# Altium project Main-PCB-v1.0.PrjPcb (part 1 of 3)
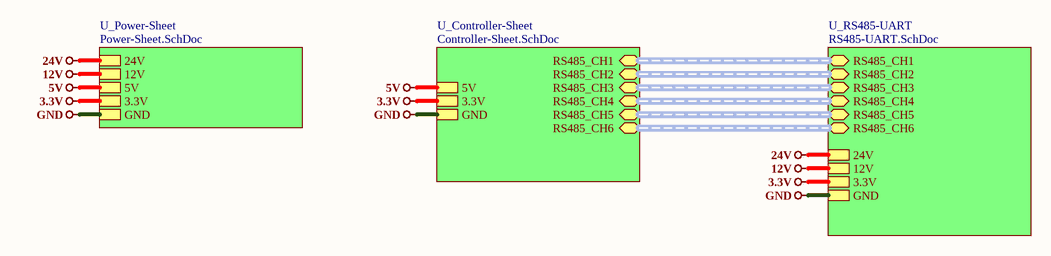
[diagram p0: Top_Sheet.SchDoc]
4 sheets, 252 parts. Net scope: hierarchical (ports join the sheet entries above them; power ports are global).
Board file: Main-PCB-v1.0.PcbDoc
Sheets:
  Top_Sheet.SchDoc
    U_Controller-Sheet = Controller-Sheet.SchDoc
    U_Power-Sheet = Power-Sheet.SchDoc
    U_RS485-UART = RS485-UART.SchDoc

## Sheet Top_Sheet.SchDoc
size A4; SheetNumber: 1; SheetTotal: 4

### Sub-sheets
U_Controller-Sheet = Controller-Sheet.SchDoc: RS485_CH1 (bidir, harness RS485_CH1), RS485_CH2 (bidir, harness RS485_CH2), RS485_CH3 (bidir, harness RS485_CH3), RS485_CH4 (bidir, harness RS485_CH4), RS485_CH5 (bidir, harness RS485_CH5), RS485_CH6 (bidir, harness RS485_CH6), GND, 3.3V, 5V
U_Power-Sheet = Power-Sheet.SchDoc: GND, 3.3V, 12V, 24V, 5V
U_RS485-UART = RS485-UART.SchDoc: RS485_CH1 (bidir, harness RS485_CH1), RS485_CH2 (bidir, harness RS485_CH2), RS485_CH3 (bidir, harness RS485_CH3), RS485_CH4 (bidir, harness RS485_CH4), RS485_CH5 (bidir, harness RS485_CH5), RS485_CH6 (bidir, harness RS485_CH6), GND, 3.3V, 12V, 24V

### Nets
3.3V: sheet U_Controller-Sheet/3.3V, sheet U_Power-Sheet/3.3V, sheet U_RS485-UART/3.3V
5V: sheet U_Controller-Sheet/5V, sheet U_Power-Sheet/5V
12V: sheet U_Power-Sheet/12V, sheet U_RS485-UART/12V
24V: sheet U_Power-Sheet/24V, sheet U_RS485-UART/24V
GND: sheet U_Controller-Sheet/GND, sheet U_Power-Sheet/GND, sheet U_RS485-UART/GND

### Buses and harness runs
harness sheet U_Controller-Sheet/RS485_CH1 = sheet U_RS485-UART/RS485_CH1
harness sheet U_Controller-Sheet/RS485_CH2 = sheet U_RS485-UART/RS485_CH2
harness sheet U_Controller-Sheet/RS485_CH3 = sheet U_RS485-UART/RS485_CH3
harness sheet U_Controller-Sheet/RS485_CH4 = sheet U_RS485-UART/RS485_CH4
harness sheet U_Controller-Sheet/RS485_CH5 = sheet U_RS485-UART/RS485_CH5
harness sheet U_Controller-Sheet/RS485_CH6 = sheet U_RS485-UART/RS485_CH6

## Sheet Controller-Sheet.SchDoc
size 420 x 297 mm; SheetNumber: 3; SheetTotal: 4
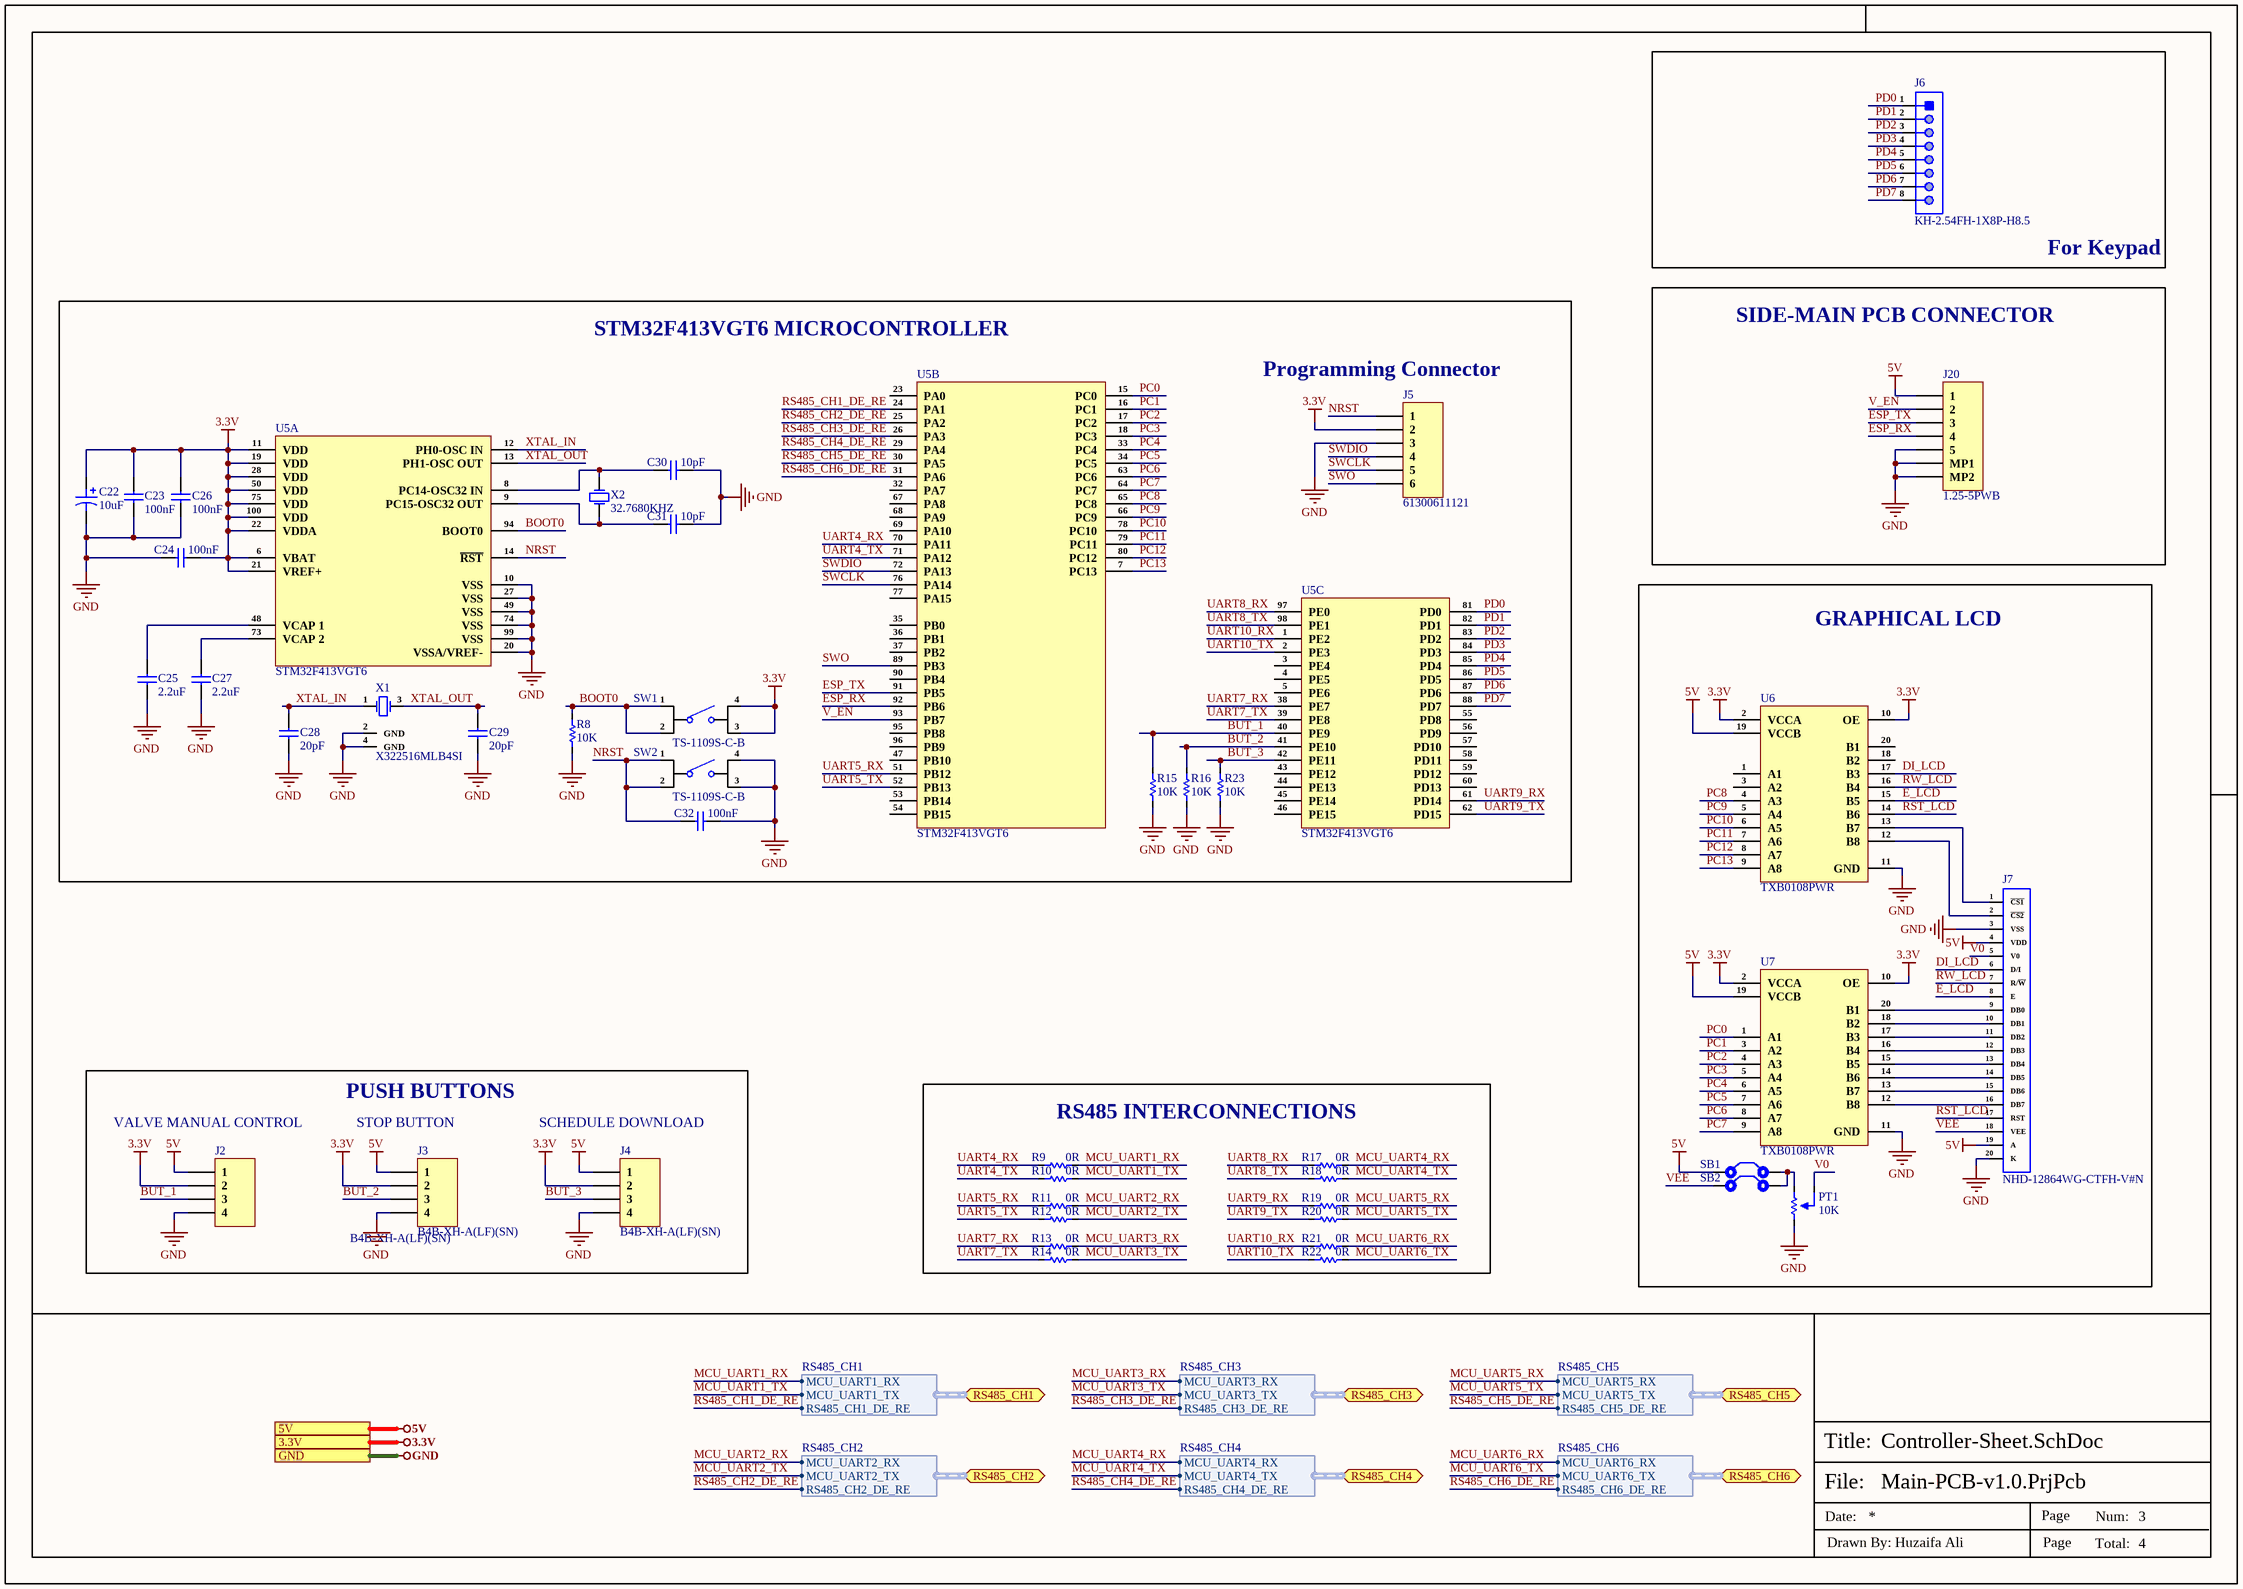
[diagram p1: Controller-Sheet.SchDoc]

### Parts
C22  10uF  [Case-A]
C23  100nF  [Cap-0603]
C24  100nF  [Cap-0603]
C25  2.2uF  [Cap-0805]
C26  100nF  [Cap-0603]
C27  2.2uF  [Cap-0805]
C28  20pF  [Cap-0603]
C29  20pF  [Cap-0603]
C30  10pF  [Cap-0603]
C31  10pF  [Cap-0603]
C32  100nF  [Cap-0603]
J2  B4B-XH-A(LF)(SN)  [B4B-XH-A(LF)(SN).]
J3  B4B-XH-A(LF)(SN)  [B4B-XH-A(LF)(SN).]
J4  B4B-XH-A(LF)(SN)  [B4B-XH-A(LF)(SN).]
J5  61300611121  [HDR1X6_]
J6  KH-2.54FH-1X8P-H8.5  [HDR1X8 Female]
J7  NHD-12864WG-CTFH-V#N  [NHD-12864WG-CTFH-V#N]
J20  1.25-5PWB  [1.25-5PWB]
PT1  10K  [3313J-1-103E]
R8  10K  [Res-0402]
R9  0R  [Res-0402]
R10  0R  [Res-0402]
R11  0R  [Res-0402]
R12  0R  [Res-0402]
R13  0R  [Res-0402]
R14  0R  [Res-0402]
R15  10K  [Res-0402]
R16  10K  [Res-0402]
R17  0R  [Res-0402]
R18  0R  [Res-0402]
R19  0R  [Res-0402]
R20  0R  [Res-0402]
R21  0R  [Res-0402]
R22  0R  [Res-0402]
R23  10K  [Res-0402]
SB1  Solder Bridge 0402  [Solder Bridge 0402]  (value not drawn)
SB2  Solder Bridge 0402  [Solder Bridge 0402]  (value not drawn)
SW1  TS-1109S-C-B  [TS-1109S-C-B]
SW2  TS-1109S-C-B  [TS-1109S-C-B]
U5  STM32F413VGT6  [LQFP-100]  (parts A,B,C of 3)
U6  TXB0108PWR  [TSSOP-20]
U7  TXB0108PWR  [TSSOP-20]
X1  X322516MLB4SI  [SMD3225-4P]
X2  32.7680KHZ  [NX3215SA-32.768K-STD-MUA-8_]

### Blocks framed on the sheet
For Keypad: J6
SIDE-MAIN PCB CONNECTOR: J20
GRAPHICAL LCD: J7 PT1 SB1 SB2 U6 U7
PUSH BUTTONS: J2-J4
RS485 INTERCONNECTIONS: R9-R14 R17-R22

### Ports
3.3V, 5V, GND, RS485_CH1 (bidir, harness RS485_CH1), RS485_CH2 (bidir, harness RS485_CH2), RS485_CH3 (bidir, harness RS485_CH3), RS485_CH4 (bidir, harness RS485_CH4), RS485_CH5 (bidir, harness RS485_CH5), RS485_CH6 (bidir, harness RS485_CH6)

### Harnesses
RS485_CH1: MCU_UART1_RX, MCU_UART1_TX, RS485_CH1_DE_RE
RS485_CH2: MCU_UART2_RX, MCU_UART2_TX, RS485_CH2_DE_RE
RS485_CH3: MCU_UART3_RX, MCU_UART3_TX, RS485_CH3_DE_RE
RS485_CH4: MCU_UART4_RX, MCU_UART4_TX, RS485_CH4_DE_RE
RS485_CH5: MCU_UART5_RX, MCU_UART5_TX, RS485_CH5_DE_RE
RS485_CH6: MCU_UART6_RX, MCU_UART6_TX, RS485_CH6_DE_RE

### Nets
3.3V: C22.1 C23.2 C24.2 C26.2 J2.2 J3.2 J4.2 J5.2 SW1.3 SW1.4 U5.6(VBAT) U5.11(VDD) U5.19(VDD) U5.21(VREF+) U5.22(VDDA) U5.28(VDD) U5.50(VDD) U5.75(VDD) U5.100(VDD) U6.2(VCCA) U6.10(OE) U7.2(VCCA) U7.10(OE) ; port 3.3V
5V: J2.1 J3.1 J4.1 J7.4(VDD) J7.19(A) J20.1 SB1.1 U6.19(VCCB) U7.19(VCCB) ; port 5V
GND: C22.2 C23.1 C24.1 C25.1 C26.1 C27.1 C28.1 C29.1 C30.2 C31.2 C32.1 J2.4 J3.4 J4.4 J5.3 J7.3(VSS) J7.20(K) J20.5 J20.MP1 J20.MP2 PT1.3(CW) R8.1 R15.1 R16.1 R23.1 SW2.3 SW2.4 U5.10(VSS) U5.20(VSSA/VREF-) U5.27(VSS) U5.49(VSS) U5.74(VSS) U5.99(VSS) U6.11(GND) U7.11(GND) X1.2(GND) X1.4(GND) ; port GND
BOOT0: R8.2 SW1.1 SW1.2 U5.94(BOOT0)
BUT_1: J2.3 R15.2 U5.40(PE9)
BUT_2: J3.3 R16.2 U5.41(PE10)
BUT_3: J4.3 R23.2 U5.42(PE11)
DI_LCD: J7.6(D/I) U6.17(B3)
E_LCD: J7.8(E) U6.15(B5)
ESP_RX: J20.4 U5.92(PB6)
ESP_TX: J20.3 U5.91(PB5)
MCU_UART1_RX: R9.2 ; port RS485_CH1.MCU_UART1_RX
MCU_UART1_TX: R10.2 ; port RS485_CH1.MCU_UART1_TX
MCU_UART2_RX: R11.2 ; port RS485_CH2.MCU_UART2_RX
MCU_UART2_TX: R12.2 ; port RS485_CH2.MCU_UART2_TX
MCU_UART3_RX: R13.2 ; port RS485_CH3.MCU_UART3_RX
MCU_UART3_TX: R14.2 ; port RS485_CH3.MCU_UART3_TX
MCU_UART4_RX: R17.2 ; port RS485_CH4.MCU_UART4_RX
MCU_UART4_TX: R18.2 ; port RS485_CH4.MCU_UART4_TX
MCU_UART5_RX: R19.2 ; port RS485_CH5.MCU_UART5_RX
MCU_UART5_TX: R20.2 ; port RS485_CH5.MCU_UART5_TX
MCU_UART6_RX: R21.2 ; port RS485_CH6.MCU_UART6_RX
MCU_UART6_TX: R22.2 ; port RS485_CH6.MCU_UART6_TX
NRST: C32.2 J5.1 SW2.1 SW2.2 U5.14(~{RST})
PC0: U5.15(PC0) U7.1(A1)
PC1: U5.16(PC1) U7.3(A2)
PC2: U5.17(PC2) U7.4(A3)
PC3: U5.18(PC3) U7.5(A4)
PC4: U5.33(PC4) U7.6(A5)
PC5: U5.34(PC5) U7.7(A6)
PC6: U5.63(PC6) U7.8(A7)
PC7: U5.64(PC7) U7.9(A8)
PC8: U5.65(PC8) U6.4(A3)
PC9: U5.66(PC9) U6.5(A4)
PC10: U5.78(PC10) U6.6(A5)
PC11: U5.79(PC11) U6.7(A6)
PC12: U5.80(PC12) U6.8(A7)
PC13: U5.7(PC13) U6.9(A8)
PD0: J6.1 U5.81(PD0)
PD1: J6.2 U5.82(PD1)
PD2: J6.3 U5.83(PD2)
PD3: J6.4 U5.84(PD3)
PD4: J6.5 U5.85(PD4)
PD5: J6.6 U5.86(PD5)
PD6: J6.7 U5.87(PD6)
PD7: J6.8 U5.88(PD7)
RS485_CH1_DE_RE: U5.24(PA1) ; port RS485_CH1.RS485_CH1_DE_RE
RS485_CH2_DE_RE: U5.25(PA2) ; port RS485_CH2.RS485_CH2_DE_RE
RS485_CH3_DE_RE: U5.26(PA3) ; port RS485_CH3.RS485_CH3_DE_RE
RS485_CH4_DE_RE: U5.29(PA4) ; port RS485_CH4.RS485_CH4_DE_RE
RS485_CH5_DE_RE: U5.30(PA5) ; port RS485_CH5.RS485_CH5_DE_RE
RS485_CH6_DE_RE: U5.31(PA6) ; port RS485_CH6.RS485_CH6_DE_RE
RST_LCD: J7.17(RST) U6.14(B6)
RW_LCD: J7.7(R/~{W}) U6.16(B4)
SWCLK: J5.5 U5.76(PA14)
SWDIO: J5.4 U5.72(PA13)
SWO: J5.6 U5.89(PB3)
UART4_RX: R9.1 U5.70(PA11)
UART4_TX: R10.1 U5.71(PA12)
UART5_RX: R11.1 U5.51(PB12)
UART5_TX: R12.1 U5.52(PB13)
UART7_RX: R13.1 U5.38(PE7)
UART7_TX: R14.1 U5.39(PE8)
UART8_RX: R17.1 U5.97(PE0)
UART8_TX: R18.1 U5.98(PE1)
UART9_RX: R19.1 U5.61(PD14)
UART9_TX: R20.1 U5.62(PD15)
UART10_RX: R21.1 U5.1(PE2)
UART10_TX: R22.1 U5.2(PE3)
V0: J7.5(V0) PT1.2(Wiper)
V_EN: J20.2 U5.93(PB7)
VEE: J7.18(VEE) SB2.1
XTAL_IN: C28.2 U5.12(PH0-OSC_IN) X1.1(CRYSTAL)
XTAL_OUT: C29.2 U5.13(PH1-OSC_OUT) X1.3(CRYSTAL)
NetC25_2: C25.2 U5.48(VCAP_1)
NetC27_2: C27.2 U5.73(VCAP_2)
NetC30_1: C30.1 U5.8(PC14-OSC32_IN) X2.1(OSC1)
NetC31_1: C31.1 U5.9(PC15-OSC32_OUT) X2.2(OSC2)
NetJ7_1: J7.1(~{CS1}) U6.13(B7)
NetJ7_2: J7.2(~{CS2}) U6.12(B8)
NetJ7_9: J7.9(DB0) U7.20(B1)
NetJ7_10: J7.10(DB1) U7.18(B2)
NetJ7_11: J7.11(DB2) U7.17(B3)
NetJ7_12: J7.12(DB3) U7.16(B4)
NetJ7_13: J7.13(DB4) U7.15(B5)
NetJ7_14: J7.14(DB5) U7.14(B6)
NetJ7_15: J7.15(DB6) U7.13(B7)
NetJ7_16: J7.16(DB7) U7.12(B8)
NetPT1_1: PT1.1(CCW) SB1.2 SB2.2

Not connected (* = marked no-connect by the designer): U5 3(PE4) 4(PE5) 5(PE6) 23(PA0) 32(PA7) 35(PB0) 36(PB1) 37(PB2) 43(PE12) 44(PE13) 45(PE14) 46(PE15) 47(PB10) 53(PB14) 54(PB15) 55(PD8) 56(PD9) 57(PD10) 58(PD11) 59(PD12) 60(PD13) 67(PA8) 68(PA9) 69(PA10) 77(PA15) 90(PB4) 95(PB8) 96(PB9); U6 1(A1) 3(A2) 18(B2) 20(B1)

### Notes on the sheet
- STM32F413VGT6 MICROCONTROLLER
- (near J5) Programming Connector
- (near J2) VALVE MANUAL CONTROL
- (near J3) STOP BUTTON
- (near J4) SCHEDULE DOWNLOAD
- File:
- Title:
- Date:
- Page
- Num:
- Total:
- Drawn By: Huzaifa Ali

### Library data of the parts
C22 = CA45-A-10V-10uF-K: 10uF 10V 8Ω@100kHz ±10% CASE-A-3216 Tantalum Capacitors ROHS; Manufacturer: CEC(Shenzhen Zhenhua XinYun Elec); Manufacturer Part Number: CA45-A-10V-10uF-K; Package: CASE-A-3216; LCSC Part Number: C128253; Item Type: Capacitor; ComponentLink1Description: LCSC; ComponentLink1URL: https://www.lcsc.com/product-detail/Tantalum-Capacitors_CEC-Shenzhen-Zhenhua-XinYun-Elec-CA45-A-10V-10uF-K_C128253.html
C23 C24 C26 C32 = CC0603KRX5R9BB104: CAP CER 0.1UF 50V X5R 0603; Manufacturer: Yageo; Tolerance: 10%; Item Type: Capacitor; Supplier 1: Digi-Key; Manufacturer Part Number: CC0603KRX5R9BB104; RoHS: Yes; Category: Ceramic Capacitors; Stock 1: 152253; Pricing 1: 1=0.10000, 10=0.05200, 50=0.02820, 100=0.02310, 500=0.01648, 1000=0.01294 (USD); Mount: Surface Mount; Case/Package: 0603; Case Code (Imperial): 0603; Case Code (Metric): 1608; Weight: 7.1E-05oz; Min Operating Temperature: -55°C; Max Operating Temperature: 85°C; Capacitance: 100nF; Packaging: Tape and Reel; Voltage Rating: 50V; Dielectric: X5R; Termination: SMD/SMT; Voltage Rating (DC): 50V; Package Quantity: 4000; Length: 0.063inch; Width: 0.031inch; Thickness: 0.035inch; Lead Free: Lead Free; Halogen Free: Halogen Free; ComponentLink1URL: http://www.mouser.com/ds/2/447/Yageo_UPY-GP_NP0_16V-to-50V_9-358835.pdf?src-supplier=Mouser; ComponentLink1Description: http://www.mouser.com/ds/2/447/Yageo_UPY-GP_NP0_16V-to-50V_9-358835.pdf?src-supplier=Mouser; ComponentLink2URL: https://www.yageo.com/upload/media/product/productsearch/datasheet/mlcc/UPY-GPHC_X5R_4V-to-50V_26.pdf?src-supplier=Digi-Key; ComponentLink2Description: https://www.yageo.com/upload/media/product/productsearch/datasheet/mlcc/UPY-GPHC_X5R_4V-to-50V_26.pdf?src-supplier=Digi-Key; ComponentLink3URL: http://www.yageo.com/exep/pages/download/literatures/ProductSelectionGuide%202014_Final_2.pdf?src-supplier=Digi-Key; ComponentLink3Description: http://www.yageo.com/exep/pages/download/literatures/ProductSelectionGuide%202014_Final_2.pdf?src-supplier=Digi-Key; Supplier Part Number 1: 311-4046-1-ND; LCSC Part Number: C110022
C25 C27 = CC0805KKX5R9BB225: CAP CER 2.2UF 50V X5R 0805; Manufacturer: Yageo; Tolerance: 10%; Item Type: Capacitor; Supplier 1: Mouser; Manufacturer Part Number: CC0805KKX5R9BB225; RoHS: Yes; Category: Ceramic Capacitors; Stock 1: 3880; Pricing 1: 1=0.26000, 10=0.12100, 50=0.12100, 100=0.08700, 1000=0.06700, 10000=0.05000 (USD); Mounting Technology: Surface Mount; Case/Package: 0805; Case Code (Metric): 2012; Case Code (Imperial): 0805; Weight: 0.000194oz; Min Operating Temperature: -55°C; Max Operating Temperature: 85°C; Packaging: Tape and Reel; Value: 2.2uF; Voltage Rating: 50V; Dielectric: X5R; Termination: SMD/SMT; Resistor Type: Ceramic; Voltage Rating (DC): 50V; Package Quantity: 3000; Length: 0.079inch; Width: 1.25mm; Thickness: 0.057inch; Lead Free: Lead Free; Halogen Free: Halogen Free; RoHS Compliant: Yes; ComponentLink1URL: http://www.mouser.com/ds/2/447/Yageo_UPY-GP_NP0_16V-to-50V_9-358835.pdf?src-supplier=Mouser; ComponentLink1Description: http://www.mouser.com/ds/2/447/Yageo_UPY-GP_NP0_16V-to-50V_9-358835.pdf?src-supplier=Mouser; ComponentLink2URL: http://www.yageo.com/documents/recent/UPY-GPHC_X5R_4V-to-50V_25.pdf?src-supplier=Digi-Key; ComponentLink2Description: http://www.yageo.com/documents/recent/UPY-GPHC_X5R_4V-to-50V_25.pdf?src-supplier=Digi-Key; Supplier Part Number 1: 603-CC805KKX5R9BB225; LCSC Part Number: C326581
C28 C29 = CC0603JRNPO9BN200: CAP CER 20PF 50V C0G/NPO 0603; Manufacturer: Yageo; Tolerance: 5%; Dielectric: C0G; Supplier 1: Digi-Key; Manufacturer Part Number: CC0603JRNPO9BN200; Stock 1: 259568; Pricing 1: 1=0.1, 10=0.048, 100=0.0214, 500=0.01526, 1000=0.01198 (USD); Mount: Surface Mount; Case/Package: 0603; Number of Pins: 2; Weight: 7.1E-05oz; Case Code (Imperial): 0603; Case Code (Metric): 1608; Min Operating Temperature: -55°C; Max Operating Temperature: 125°C; Capacitance: 20pF; Package Quantity: 4000; Voltage Rating (DC): 50V; Packaging: Tape and Reel; Voltage Rating: 50V; Termination: SMD/SMT; Composition: Ceramic; Length: 1.6mm; Width: 0.8mm; Thickness: 0.035inch; Depth: 0.8mm; REACH SVHC: Unknown; Lead Free: Lead Free; ComponentLink1URL: http://www.farnell.com/datasheets/1132289.pdf?src-supplier=Element14; ComponentLink1Description: http://www.farnell.com/datasheets/1132289.pdf?src-supplier=Element14; ComponentLink2URL: http://www.yageo.com/documents/recent/UPY-GP_NP0_16V-to-50V_16.pdf?src-supplier=Digi-Key; ComponentLink2Description: http://www.yageo.com/documents/recent/UPY-GP_NP0_16V-to-50V_16.pdf?src-supplier=Digi-Key; Supplier Part Number 1: 311-1424-6-ND; LCSC Part Number: C105621
C30 C31 = CC0603JRNPO9BN100: CAP CER 10PF 50V C0G/NPO 0603; Manufacturer: Yageo; Tolerance: 5%; Dielectric: C0G; Temperature Coefficient: 30ppm/°C; Insulation Resistance: 100GR; ComponentLink1URL: https://datasheet.ciiva.com/25787/cl10a475ka8nqnc-25787017.pdf?src-supplier=Digi-Key; ComponentLink1Description: https://datasheet.ciiva.com/25787/cl10a475ka8nqnc-25787017.pdf?src-supplier=Digi-Key; ComponentLink2URL: https://datasheet.ciiva.com/144/mlccorderingcode-144651.pdf?src-supplier=Digi-Key; ComponentLink2Description: https://datasheet.ciiva.com/144/mlccorderingcode-144651.pdf?src-supplier=Digi-Key; ComponentLink3URL: https://datasheet.ciiva.com/11786/0900766b8079c870-11786407.pdf?src-supplier=RSComponents; ComponentLink3Description: https://datasheet.ciiva.com/11786/0900766b8079c870-11786407.pdf?src-supplier=RSComponents; ComponentLink4URL: https://datasheet.ciiva.com/5789/1734582-5789616.pdf?src-supplier=Farnell; ComponentLink4Description: https://datasheet.ciiva.com/5789/1734582-5789616.pdf?src-supplier=Farnell; ComponentLink5URL: https://datasheet.ciiva.com/26862/getdatasheetpartid-403524-26862758.pdf?src-supplier=Verical; ComponentLink5Description: https://datasheet.ciiva.com/26862/getdatasheetpartid-403524-26862758.pdf?src-supplier=Verical; ComponentLink6URL: https://datasheet.ciiva.com/7978/1132289-7978126.pdf?src-supplier=Element14; ComponentLink6Description: https://datasheet.ciiva.com/7978/1132289-7978126.pdf?src-supplier=Element14; ComponentLink7URL: https://datasheet.ciiva.com/46430/1835847-46430150.pdf?src-supplier=Element14; ComponentLink7Description: https://datasheet.ciiva.com/46430/1835847-46430150.pdf?src-supplier=Element14; ComponentLink8URL: https://datasheet.ciiva.com/144/mlccorderingcode-144650.pdf?src-supplier=Digi-Key; ComponentLink8Description: https://datasheet.ciiva.com/144/mlccorderingcode-144650.pdf?src-supplier=Digi-Key; ComponentLink9URL: https://datasheet.ciiva.com/144/mlccorderingcode-144649.pdf?src-supplier=Digi-Key; ComponentLink9Description: https://datasheet.ciiva.com/144/mlccorderingcode-144649.pdf?src-supplier=Digi-Key; ComponentLink10URL: https://datasheet.ciiva.com/5425/upy-gp-np0-16v-to-50v-8-5425564.pdf?src-supplier=Mouser; ComponentLink10Description: https://datasheet.ciiva.com/5425/upy-gp-np0-16v-to-50v-8-5425564.pdf?src-supplier=Mouser; ComponentLink11URL: https://datasheet.ciiva.com/8033/1734582-8033710.pdf?src-supplier=Element14; ComponentLink11Description: https://datasheet.ciiva.com/8033/1734582-8033710.pdf?src-supplier=Element14; ComponentLink12URL: https://datasheet.ciiva.com/8033/1734582-8033706.pdf?src-supplier=Element14; ComponentLink12Description: https://datasheet.ciiva.com/8033/1734582-8033706.pdf?src-supplier=Element14; Supplier 1: Digi-Key; Manufacturer Part Number: CC0603JRNPO9BN100; RoHS: Yes; Category: Ceramic Capacitors; Stock 1: 1700978; Pricing 1: 1=0.10000, 10=0.03900, 50=0.02120, 100=0.01740, 500=0.01240, 1000=0.00974 (USD); Mount: Surface Mount; Case/Package: 0603; Number of Pins: 2; Case Code (Metric): 1608; Case Code (Imperial): 0603; Min Operating Temperature: -55°C; Max Operating Temperature: 125°C; Capacitance: 10pF; Voltage: 50V; Voltage Rating: 50V; Voltage Rating (DC): 50V; Packaging: Tape and Reel; Package Quantity: 1; Termination: SMD/SMT; Resistor Type: Ceramic; Series: CC; Length: 1.6mm; Width: 0.031inch; Height: 0.8mm; Thickness: 0.035inch; Depth: 0.8mm; Radiation Hardening: No; RoHS Compliant: Yes; REACH SVHC: No SVHC; Lead Free: Lead Free; Supplier Part Number 1: 311-1058-1-ND; LCSC Part Number: C106245
J2-J4 = B4B-XH-A(LF)(SN): CONN HEADER VERT 4POS 2.5MM; Manufacturer: JST; Current Rating: 3A; Gender: Male; Contact Resistance: 20mR; Voltage Rating (AC): 250V; Connector Type: Male Pin; Number of Positions: 4; Insulation Resistance: 1GR; Wire/Cable Gauge: 22AWG; Item Type: JST Connector; Supplier 1: Future Electronics; Manufacturer Part Number: B4B-XH-A(LF)(SN); RoHS: Yes; Category: FFC / FPC; Pricing 1: 1=0.13000, 300=0.11300, 1000=0.11000, 3000=0.10700, 10000=0.10400 (USD); Mount: Through Hole; Contact Material: Brass; Material: Polyamide; Contact Plating: Tin,Copper,Lead; Color: Natural; Housing Material: Polyamide; Housing Color: White; Min Operating Temperature: -25°C; Max Operating Temperature: 85°C; Number of Rows: 1; Max Current Rating: 3A; Package Quantity: 500; Packaging: Bulk; Voltage Rating: 250V; Termination: Press-Fit; Max Voltage Rating (AC): 250V; Max Voltage Rating (DC): 250V; Number of Contacts: 4; Orientation: Straight; Length: 12.4mm; Pitch: 2.5mm; Lead Pitch: 2.5mm; Depth: 5.75mm; REACH SVHC: No SVHC; Lead Free: Lead Free; ComponentLink1URL: https://datasheet.ciiva.com/26894/getdatasheetpartid-455616-26894787.pdf?src-supplier=Verical; ComponentLink1Description: https://datasheet.ciiva.com/26894/getdatasheetpartid-455616-26894787.pdf?src-supplier=Verical; ComponentLink2URL: https://datasheet.ciiva.com/26924/getdatasheetpartid-640571-26924035.pdf?src-supplier=Verical; ComponentLink2Description: https://datasheet.ciiva.com/26924/getdatasheetpartid-640571-26924035.pdf?src-supplier=Verical; ComponentLink3URL: https://datasheet.ciiva.com/16203/b4b-xh-alfsn-16203642.pdf?src-supplier=Future+Electronics; ComponentLink3Description: https://datasheet.ciiva.com/16203/b4b-xh-alfsn-16203642.pdf?src-supplier=Future+Electronics; ComponentLink4URL: https://datasheet.ciiva.com/726/exh-726404.pdf?src-supplier=Digi-Key; ComponentLink4Description: https://datasheet.ciiva.com/726/exh-726404.pdf?src-supplier=Digi-Key; Supplier Part Number 1: 8134090; LCSC Part Number: C144395
J5 = 61300611121: CONN HEADER 6 POS 2.54; Manufacturer: Wurth Electronics; Current Rating: 3A; Voltage Rating: 250V; Number of Positions: 6; Gender: Male; Connector Type: Male Pin; Pitch: 0.1inch; Supplier 1: Newark; Manufacturer Part Number: 61300611121; RoHS: Yes; Category: Headers and Wire Housings; Stock 1: 4996; Pricing 1: 1=0.34000, 10=0.28900, 25=0.24000, 50=0.20100, 100=0.18200 (USD); Mount: Through Hole; Contact Plating: Gold; Contact Material: Copper Alloy,Copper; Housing Material: PBT; Color: Black; Min Operating Temperature: -40°C; Max Operating Temperature: 125°C; Number of Rows: 1; Contact Gender: Male; Packaging: Bulk; Termination: Through Hole; Number of Contacts: 6; Series: WR-PHD; Contact Type: Male Pin; Contact Mating Length: 0.236inch; REACH SVHC: Unknown; Lead Free: Lead Free; RoHS Compliant: Yes; ComponentLink1URL: http://www.mouser.com/ds/2/445/6130xx11121-538006.pdf?src-supplier=Mouser; ComponentLink1Description: http://www.mouser.com/ds/2/445/6130xx11121-538006.pdf?src-supplier=Mouser; ComponentLink2URL: http://www.farnell.com/cad/1737268.pdf?src-supplier=Element14; ComponentLink2Description: http://www.farnell.com/cad/1737268.pdf?src-supplier=Element14; ComponentLink3URL: https://katalog.we-online.de/em/datasheet/6130xx11121.pdf?src-supplier=Digi-Key; ComponentLink3Description: https://katalog.we-online.de/em/datasheet/6130xx11121.pdf?src-supplier=Digi-Key; Supplier Part Number 1: 20X0957; Item Type: Header
J6 = KH-2.54FH-1X8P-H8.5: 2.54mm Plugin 3A -40℃~+105℃ Straight 1x8P 8.5mm Top 8 Square Holes Plugin,P=2.54mm Female Headers ROHS; Manufacturer: Shenzhen Kinghelm Elec; Item Type: Header; Manufacturer Part Number: KH-2.54FH-1X8P-H8.5; Package: Plugin,P=2.54mm; LCSC Part Number: C2905417; ComponentLink1Description: LCSC; ComponentLink1URL: https://www.lcsc.com/product-detail/span-style-background-color-ff0-Female-span-Headers_Shenzhen-Kinghelm-Elec-KH-2-54FH-1X8P-H8-5_C2905417.html
J7 = NHD-12864WG-CTFH-V#N: 2.54mm Plugin Brass Straight 1x20P 20 Plugin,P=2.54mm Female Headers ROHS; Manufacturer: Ckmtw(Shenzhen Cankemeng); Manufacturer Part Number: B-2200S20P-A120; Item Type: Header; Package: Plugin,P=2.54mm; LCSC Part Number: C124410; ComponentLink1Description: LCSC; ComponentLink1URL: https://www.lcsc.com/product-detail/span-style-background-color-ff0-Female-span-Headers_Ckmtw-Shenzhen-Cankemeng-B-2200S20P-A120_C124410.html
J20 = 1.25-5PWB: 1x5P 1 1.25mm Male pin 5 -25℃~+85℃ Surface Mount SMD,P=1.25mm Wire To Board / Wire To Wire Connector ROHS; Manufacturer: DEALON; Item Type: JST Right Angle; Manufacturer Part Number: 1.25-5PWB; Package: SMD,P=1.25mm; LCSC Part Number: C2905012; ComponentLink1Description: LCSC; ComponentLink1URL: https://www.lcsc.com/product-detail/Wire-To-Board-Wire-To-Wire-Connector_DEALON-1-25-5PWB_C2905012.html
PT1 = 3313J-1-103E: TRIMMER 10KOHM 0.125W J LEAD TOP; Manufacturer: Bourns; Value: 10kR; Tolerance: 20%; Power Rating: 125mW; Number of Turns: 1; Temperature Coefficient: 100ppm/°C; Insulation Resistance: 100MR; Voltage Rating (DC): 500V; Item Type: Potentiometer; Supplier 1: Digi-Key; Manufacturer Part Number: 3313J-1-103E; RoHS: Yes; Category: Variable Resistors and Potentiometers; Stock 1: 15653; Pricing 1: 1=1.83, 10=1.611, 25=1.4444, 50=1.3888, 100=1.3332, 250=1.27764, 500=1.05544 (USD); Mounting Technology: Surface Mount; Weight: 283mg; Color: Natural; Min Operating Temperature: -55°C; Max Operating Temperature: 125°C; Resistor Type: Cermet; Package Quantity: 1000; Packaging: Tape and Reel; Termination: J-Hook; Taper: Linear; Max Power Dissipation: 125mW; Type: Potentiometer; Series: Trimpot® 3313 - Sealed; Resistance Tolerance: 20%; Technology: CERMET; Length: 3.2mm; Width: 3.2mm; Height: 2.2mm; Depth: 3.5mm; Radiation Hardening: No; Reach SVHC Compliant: No; Military Standard: Not; Lead Free: Lead Free; RoHS Compliant: Yes; ComponentLink1URL: https://datasheet.ciiva.com/6197/1719390-6197392.pdf?src-supplier=Farnell; ComponentLink1Description: https://datasheet.ciiva.com/6197/1719390-6197392.pdf?src-supplier=Farnell; ComponentLink2URL: https://datasheet.ciiva.com/11831/0900766b80dbb89c-11831555.pdf?src-supplier=Rs; ComponentLink2Description: https://datasheet.ciiva.com/11831/0900766b80dbb89c-11831555.pdf?src-supplier=Rs; ComponentLink3URL: https://datasheet.ciiva.com/43573/1157501-43573718.pdf?src-supplier=Jameco; ComponentLink3Description: https://datasheet.ciiva.com/43573/1157501-43573718.pdf?src-supplier=Jameco; ComponentLink4URL: https://datasheet.ciiva.com/7953/1864507-7953225.pdf?src-supplier=Element14; ComponentLink4Description: https://datasheet.ciiva.com/7953/1864507-7953225.pdf?src-supplier=Element14; ComponentLink5URL: https://datasheet.ciiva.com/28659/1770668-28659191.pdf?src-supplier=Element14; ComponentLink5Description: https://datasheet.ciiva.com/28659/1770668-28659191.pdf?src-supplier=Element14; ComponentLink6URL: https://datasheet.ciiva.com/2156/3313-2156355.pdf?src-supplier=Digi-Key; ComponentLink6Description: https://datasheet.ciiva.com/2156/3313-2156355.pdf?src-supplier=Digi-Key; ComponentLink7URL: https://datasheet.ciiva.com/2156/3313-2156356.pdf?src-supplier=Digi-Key; ComponentLink7Description: https://datasheet.ciiva.com/2156/3313-2156356.pdf?src-supplier=Digi-Key; ComponentLink8URL: https://datasheet.ciiva.com/2156/3313-2156354.pdf?src-supplier=Digi-Key; ComponentLink8Description: https://datasheet.ciiva.com/2156/3313-2156354.pdf?src-supplier=Digi-Key; ComponentLink9URL: https://datasheet.ciiva.com/16715/70153423-16715693.pdf?src-supplier=Allied+Electronics; ComponentLink9Description: https://datasheet.ciiva.com/16715/70153423-16715693.pdf?src-supplier=Allied+Electronics; Supplier Part Number 1: 3313J-103ECT-ND; LCSC Part Number: C124616
R8 R15 R16 R23 = RC0402FR-0710KL: RES 10K OHM 1% 1/16W 0402; Manufacturer: Yageo; Resistance: 10kR; Voltage Rating (DC): 50V; Temperature Coefficient: 100ppm/°C; Power Rating: 62.5mW; Max Power Dissipation: 63mW; Supplier 1: Mouser; Manufacturer Part Number: RC0402FR-0710KL; RoHS: Yes; Category: Chip SMD Resistors; Stock 1: 18648329; Pricing 1: 1=0.10000, 10=0.01400, 50=0.01400, 100=0.00500, 1000=0.00300, 10000=0.00200 (USD); Case/Package: 0402; Number of Pins: 2; Case Code (Imperial): 0402; Case Code (Metric): 1005; Min Operating Temperature: -55°C; Max Operating Temperature: 155°C; Resistor Type: Thick Film; Tolerance: 1%; Packaging: Tape and Reel; Voltage Rating: 50V; Termination: SMD/SMT; Working Voltage: 50V; Number of Terminations: 2; Features: Moisture Resistant; Series: RC; Resistance Tolerance: 1%; Construction: Rectangular; Length: 1mm; Width: 0.5mm; Height: 0.32mm; Depth: 0.5mm; Lead Pitch: 0.2mm; REACH SVHC: No SVHC; Lead Free: Lead Free; RoHS Compliant: Yes; Military Standard: Not; ComponentLink1URL: https://datasheet.ciiva.com/7660/38568-7660787.pdf?src-supplier=Element14; ComponentLink1Description: https://datasheet.ciiva.com/7660/38568-7660787.pdf?src-supplier=Element14; ComponentLink2URL: https://datasheet.ciiva.com/7849/1686128-7849814.pdf?src-supplier=Element14; ComponentLink2Description: https://datasheet.ciiva.com/7849/1686128-7849814.pdf?src-supplier=Element14; ComponentLink3URL: https://datasheet.ciiva.com/7983/1018594-7983486.pdf?src-supplier=Element14; ComponentLink3Description: https://datasheet.ciiva.com/7983/1018594-7983486.pdf?src-supplier=Element14; ComponentLink4URL: https://datasheet.ciiva.com/22747/1018594-22747512.pdf?src-supplier=Element14; ComponentLink4Description: https://datasheet.ciiva.com/22747/1018594-22747512.pdf?src-supplier=Element14; ComponentLink5URL: https://datasheet.ciiva.com/12667/pyu-rc0402-51-rohs-l-6-r-12667067.pdf?src-supplier=Mouser; ComponentLink5Description: https://datasheet.ciiva.com/12667/pyu-rc0402-51-rohs-l-6-r-12667067.pdf?src-supplier=Mouser; ComponentLink6URL: https://datasheet.ciiva.com/7849/1784430-7849813.pdf?src-supplier=Element14; ComponentLink6Description: https://datasheet.ciiva.com/7849/1784430-7849813.pdf?src-supplier=Element14; ComponentLink7URL: https://datasheet.ciiva.com/7849/1784430-7849815.pdf?src-supplier=Element14; ComponentLink7Description: https://datasheet.ciiva.com/7849/1784430-7849815.pdf?src-supplier=Element14; Supplier Part Number 1: 603-RC0402FR-0710KL; LCSC Part Number: C60490
R9-R14 R17-R22 = RC0402FR-070RL: RES 0 OHM JUMPER 1/16W 0402; Manufacturer: Yageo; Tolerance: 1%; Power Rating: 62.5mW; Voltage Rating: 50V; Temperature Coefficient: 200ppm/°C; Max Power Dissipation: 63mW; Supplier 1: Mouser; Manufacturer Part Number: RC0402FR-070RL; RoHS: Yes; Category: Chip SMD Resistors; Stock 1: 8556842; Pricing 1: 1=0.10000, 10=0.01400, 50=0.01400, 100=0.00600, 1000=0.00300, 5000=0.00200, 10000=0.00100 (USD); Mount: Surface Mount; Case/Package: 0402; Contact Plating: Tin,Matte; Case Code (Imperial): 0402; Case Code (Metric): 1005; Size Code: 0402; Min Operating Temperature: -55°C; Max Operating Temperature: 155°C; Resistance: 0R; Resistor Type: Thick Film; Packaging: Tape and Reel; Termination: SMD/SMT; Features: Moisture Resistant; Series: RC; Number of Terminations: 2; Length: 1mm; Width: 0.5mm; Height: 0.35mm; Radiation Hardening: No; Lead Free: Lead Free; RoHS Compliant: Yes; ComponentLink1URL: https://datasheet.ciiva.com/8896/pyu-rc0402-51-rohs-l-6-8896149.pdf?src-supplier=Avnet; ComponentLink1Description: https://datasheet.ciiva.com/8896/pyu-rc0402-51-rohs-l-6-8896149.pdf?src-supplier=Avnet; ComponentLink2URL: https://datasheet.ciiva.com/16790/pyu-rc0402-51-rohs-l-6-r-16790444.pdf?src-supplier=Future+Electronics; ComponentLink2Description: https://datasheet.ciiva.com/16790/pyu-rc0402-51-rohs-l-6-r-16790444.pdf?src-supplier=Future+Electronics; Supplier Part Number 1: 603-RC0402FR-070RL; LCSC Part Number: C106231
SB1 SB2 = Solder Bridge 0402: Solder Bridge ON; Manufacturer Part Number: Solder Bridge 0402; Item Type: Solder Bridge
SW1 SW2 = TS-1109S-C-B: No NO 50mA 4.5mm 100000 260gf 12V -30℃~+85℃ 4.5mm 4.3mm Black Round Button Brick nogging SPST SMD Tactile Switches ROHS; Manufacturer: XKB Connectivity; Item Type: Switch; Manufacturer Part Number: TS-1109S-C-B; Package: Custom; LCSC Part Number: C381037; ComponentLink1Description: LCSC; ComponentLink1URL: https://www.lcsc.com/product-detail/Tactile-Switches_XKB-Connectivity-TS-1109S-C-B_C381037.html
U5 = STM32F413VGT6: MCU 32-bit ARM Cortex M4 RISC 1MB Flash 3.3V 100-Pin LQFP Frame; Manufacturer: STMicroelectronics; Interface: I2C,SPI,USB,IrDA,MMC,SDIO,UART,USART,EBI/EMI; Peripherals: Brown-out Detect/Reset,POR,PWM,WDT,DMA,LCD; Number of I/Os: 81; Oscillator Type: Internal; Item Type: IC; Supplier 1: Mouser; Manufacturer Part Number: STM32F413VGT6; RoHS: Yes; Category: Microcontrollers; Stock 1: 941; Pricing 1: 1=14.15, 10=13, 50=12.46, 100=10.98, 1000=9.77, 10000=9.77 (USD); Case/Package: LQFP; Min Operating Temperature: -40°C; Max Operating Temperature: 85°C; Memory Format: FLASH; Packaging: Tray; Core Architecture: ARM; Memory Size: 1MB; Series: STM32F4; RoHS Compliant: Yes; ComponentLink1URL: https://4donline.ihs.com/images/VipMasterIC/IC/SGST/SGST-S-A0003533273/SGST-S-A0003533273-1.pdf?hkey=52A5661711E402568146F3353EA87419&src-supplier=Newark; ComponentLink1Description: https://4donline.ihs.com/images/VipMasterIC/IC/SGST/SGST-S-A0003533273/SGST-S-A0003533273-1.pdf?hkey=52A5661711E402568146F3353EA87419&src-supplier=Newark; ComponentLink2URL: https://4donline.ihs.com/images/VipMasterIC/IC/SGST/SGST-S-A0003533273/SGST-S-A0003533273-1.pdf?hkey=52A5661711E402568146F3353EA87419&src-supplier=Farnell; ComponentLink2Description: https://4donline.ihs.com/images/VipMasterIC/IC/SGST/SGST-S-A0003533273/SGST-S-A0003533273-1.pdf?hkey=52A5661711E402568146F3353EA87419&src-supplier=Farnell; ComponentLink3URL: http://www.farnell.com/datasheets/2581760.pdf?src-supplier=Element14; ComponentLink3Description: http://www.farnell.com/datasheets/2581760.pdf?src-supplier=Element14; ComponentLink4URL: http://www.st.com/content/ccc/resource/technical/document/datasheet/group3/f6/1d/4a/d9/f9/96/43/2a/DM00282249/files/DM00282249.pdf/jcr:content/translations/en.DM00282249.pdf?src-supplier=Digi-Key; ComponentLink4Description: http://www.st.com/content/ccc/resource/technical/document/datasheet/group3/f6/1d/4a/d9/f9/96/43/2a/DM00282249/files/DM00282249.pdf/jcr:content/translations/en.DM00282249.pdf?src-supplier=Digi-Key; Supplier Part Number 1: 511-STM32F413VGT6; LCSC Part Number: C1337293
U6 U7 = TXB0108PWR: IC 8-BIT TRNSTR 15KV ESD 20TSSOP; Manufacturer: Texas Instruments; Max Supply Voltage: 5.5V; Min Supply Voltage: 1.2V; Propagation Delay: 4ns; Output Current: 20uA; Data Rate: 100Mbps; Number of Channels: 8; Logic Function: Translator; High Level Output Current: -20uA; Turn-On Delay Time: 9.5ns; Quiescent Current: 3.5uA; Output Type: 3-STATE; Channel Type: Bidirectional; Number of Circuits: 1; Rise Time: 7.3ns; Supplier 1: Mouser; Manufacturer Part Number: TXB0108PWR; RoHS: Yes; Category: Logic ICs; Stock 1: 134319; Pricing 1: 1=1.73, 10=1.55, 50=1.47, 100=1.21, 1000=0.789, 10000=0.694 (USD); Mounting Technology: Surface Mount; Case/Package: TSSOP; Pins: 20; Weight: 0.002716oz; Min Operating Temperature: -40°C; Max Operating Temperature: 85°C; Packaging: Tape and Reel; Number of Bits: 8; Low Level Output Current: 20uA; Series: -; Package Quantity: 2000; Number of Inputs: 8; Termination: SMD/SMT; Length: 6.5mm; Width: 4.4mm; Height: 1.15mm; Radiation Hardening: No; Lead Free: Lead Free; RoHS Compliant: Yes; Reach SVHC Compliant: No; ComponentLink1URL: https://datasheet.ciiva.com/1508/1789049-1508727.pdf?src-supplier=Element14; ComponentLink1Description: https://datasheet.ciiva.com/1508/1789049-1508727.pdf?src-supplier=Element14; ComponentLink2URL: https://datasheet.ciiva.com/22653/1633674-22653426.pdf?src-supplier=Farnell; ComponentLink2Description: https://datasheet.ciiva.com/22653/1633674-22653426.pdf?src-supplier=Farnell; ComponentLink3URL: https://datasheet.ciiva.com/1628/txb0108-1628712.pdf?src-supplier=Newark; ComponentLink3Description: https://datasheet.ciiva.com/1628/txb0108-1628712.pdf?src-supplier=Newark; ComponentLink4URL: https://datasheet.ciiva.com/4834/sces643e-127095-4834434.pdf?src-supplier=Mouser; ComponentLink4Description: https://datasheet.ciiva.com/4834/sces643e-127095-4834434.pdf?src-supplier=Mouser; ComponentLink5URL: https://datasheet.ciiva.com/15096/getdatasheetpartid-189652-15096226.pdf?src-supplier=Verical; ComponentLink5Description: https://datasheet.ciiva.com/15096/getdatasheetpartid-189652-15096226.pdf?src-supplier=Verical; ComponentLink6URL: https://datasheet.ciiva.com/28499/1811182-28499660.pdf?src-supplier=Element14; ComponentLink6Description: https://datasheet.ciiva.com/28499/1811182-28499660.pdf?src-supplier=Element14; ComponentLink7URL: https://datasheet.ciiva.com/1899/txb0108-1899608.pdf?src-supplier=Digi-Key; ComponentLink7Description: https://datasheet.ciiva.com/1899/txb0108-1899608.pdf?src-supplier=Digi-Key; ComponentLink8URL: https://datasheet.ciiva.com/1899/txb0108-1899607.pdf?src-supplier=Digi-Key; ComponentLink8Description: https://datasheet.ciiva.com/1899/txb0108-1899607.pdf?src-supplier=Digi-Key; ComponentLink9URL: https://datasheet.ciiva.com/1899/txb0108-1899609.pdf?src-supplier=Digi-Key; ComponentLink9Description: https://datasheet.ciiva.com/1899/txb0108-1899609.pdf?src-supplier=Digi-Key; ComponentLink10URL: https://datasheet.ciiva.com/14287/txb0108-14287509.pdf?src-supplier=Avnet; ComponentLink10Description: https://datasheet.ciiva.com/14287/txb0108-14287509.pdf?src-supplier=Avnet; ComponentLink11URL: https://datasheet.ciiva.com/48701/001073833-da-01-en-ic-8-bit-trnstr-txb0108pwr-tssop-20-tid-48701979.pdf?src-supplier=Conrad; ComponentLink11Description: https://datasheet.ciiva.com/48701/001073833-da-01-en-ic-8-bit-trnstr-txb0108pwr-tssop-20-tid-48701979.pdf?src-supplier=Conrad; Supplier Part Number 1: 595-TXB0108PWR; LCSC Part Number: C53406; Item Type: IC
X1 = X322516MLB4SI: 16MHz SMD Crystal Resonator 9pF ±10ppm ±30ppm -40℃~+85℃ SMD3225-4P Crystals ROHS; Manufacturer: Yangxing Tech; Manufacturer Part Number: X322516MLB4SI; Package: SMD3225-4P; ComponentLink1Description: LCSC; ComponentLink1URL: https://www.lcsc.com/product-detail/Crystals_Yangxing-Tech-X322516MLB4SI_C13738.html; LCSC Part Number: C13738; Item Type: Crystal
X2 = NX3215SA-32.768K-STD-MUA-14: CRYSTAL 32.7680KHZ 6PF SMD; Manufacturer: NDK; Frequency: 32.768kHz; Frequency Tolerance: 20ppm; ESR (Equivalent Series Resistance): 70kR; Supplier 1: Rs; Manufacturer Part Number: NX3215SA-32.768K-STD-MUA-14; RoHS: Yes; Category: Crystals; Stock 1: 500; Pricing 1: 5=0.15520, 50=0.68600, 100=0.66600, 250=0.65000, 500=0.63400 (GBP); Mounting Technology: Surface Mount; Case/Package: SMD/SMT; Min Operating Temperature: -40°C; Max Operating Temperature: 85°C; Packaging: Cut Tape; Load Capacitance: 6pF; Series: NX3215SA; RoHS Compliant: Yes; ComponentLink1URL: https://datasheet.ciiva.com/6733/c-nx3215sa-std-mua-9-e-6733110.pdf?src-supplier=Digi-Key; ComponentLink1Description: https://datasheet.ciiva.com/6733/c-nx3215sa-std-mua-9-e-6733110.pdf?src-supplier=Digi-Key; ComponentLink2URL: https://datasheet.ciiva.com/6733/c-nx3215sa-std-mua-9-e-6733111.pdf?src-supplier=Digi-Key; ComponentLink2Description: https://datasheet.ciiva.com/6733/c-nx3215sa-std-mua-9-e-6733111.pdf?src-supplier=Digi-Key; ComponentLink3URL: https://datasheet.ciiva.com/6733/c-nx3215sa-std-mua-9-e-6733112.pdf?src-supplier=Digi-Key; ComponentLink3Description: https://datasheet.ciiva.com/6733/c-nx3215sa-std-mua-9-e-6733112.pdf?src-supplier=Digi-Key; Supplier Part Number 1: 1847854; LCSC Part Number: C156244; Item Type: Crystal